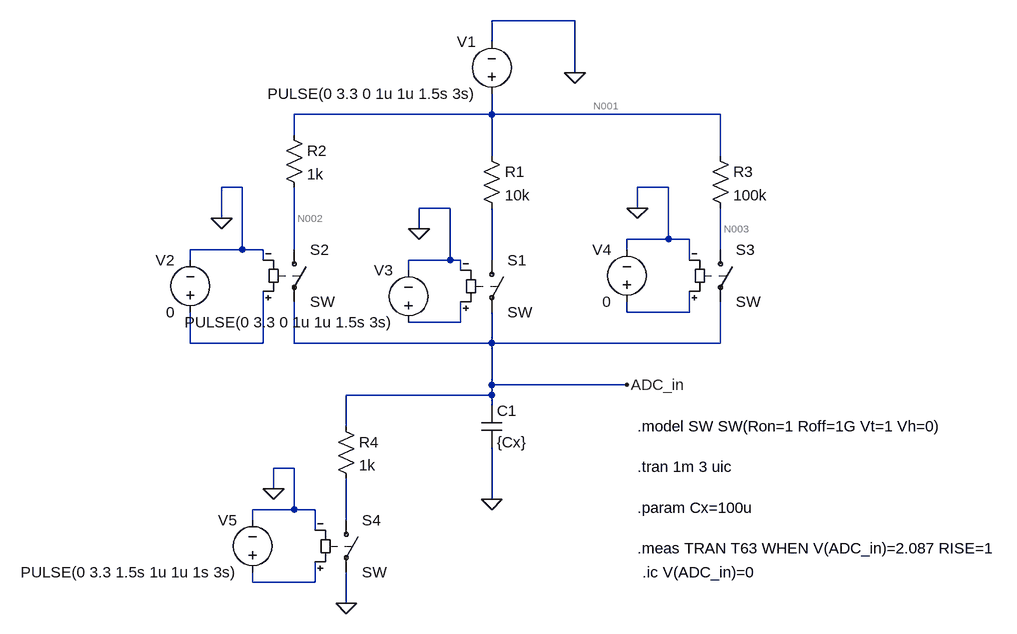
[diagram p0: schematic capacitor.asc]
capacitor.asc, the LTspice schematic file:
Version 4
SHEET 1 948 696
WIRE 272 -224 144 -224
WIRE 144 -192 144 -224
WIRE 272 -144 272 -224
WIRE 144 -80 144 -112
WIRE 144 -80 -160 -80
WIRE 496 -80 144 -80
WIRE -160 -48 -160 -80
WIRE 144 -16 144 -80
WIRE 496 -16 496 -80
WIRE -240 32 -272 32
WIRE 416 32 368 32
WIRE 80 64 32 64
WIRE 368 64 368 32
WIRE -272 80 -272 32
WIRE 32 96 32 64
WIRE 416 112 416 32
WIRE 416 112 352 112
WIRE 448 112 416 112
WIRE -240 128 -240 32
WIRE -240 128 -320 128
WIRE -208 128 -240 128
WIRE -160 128 -160 32
WIRE 352 128 352 112
WIRE 496 128 496 64
WIRE -320 144 -320 128
WIRE -208 144 -208 128
WIRE 80 144 80 64
WIRE 80 144 16 144
WIRE 96 144 80 144
WIRE 144 144 144 64
WIRE 448 144 448 112
WIRE 16 160 16 144
WIRE 96 160 96 144
WIRE 352 224 352 208
WIRE 448 224 448 192
WIRE 448 224 352 224
WIRE 96 240 96 208
WIRE 96 240 16 240
WIRE -320 272 -320 224
WIRE -208 272 -208 192
WIRE -208 272 -320 272
WIRE -160 272 -160 208
WIRE 144 272 144 224
WIRE 144 272 -160 272
WIRE 496 272 496 208
WIRE 496 272 144 272
WIRE 144 336 144 272
WIRE 352 336 144 336
WIRE 144 352 144 336
WIRE 144 352 -80 352
WIRE 144 368 144 352
WIRE -80 400 -80 352
WIRE -160 464 -192 464
WIRE -192 496 -192 464
WIRE 144 512 144 432
WIRE -160 528 -160 464
WIRE -160 528 -224 528
WIRE -128 528 -160 528
WIRE -224 544 -224 528
WIRE -80 544 -80 480
WIRE -128 560 -128 528
WIRE -224 640 -224 624
WIRE -128 640 -128 608
WIRE -128 640 -224 640
WIRE -80 672 -80 624
FLAG 144 512 0
FLAG 352 336 ADC_in
FLAG 272 -144 0
FLAG -272 80 0
FLAG 32 96 0
FLAG 368 64 0
FLAG -80 672 0
FLAG -192 496 0
SYMBOL cap 128 368 R0
SYMATTR InstName C1
SYMATTR Value {Cx}
SYMBOL sw 144 128 R0
SYMATTR InstName S1
SYMBOL sw -160 112 R0
SYMATTR InstName S2
SYMBOL sw 496 112 R0
SYMATTR InstName S3
SYMBOL res 128 -32 R0
SYMATTR InstName R1
SYMATTR Value 10k
SYMBOL res -176 -64 R0
SYMATTR InstName R2
SYMATTR Value 1k
SYMBOL res 480 -32 R0
SYMATTR InstName R3
SYMATTR Value 100k
SYMBOL voltage 144 -96 R180
WINDOW 0 24 96 Left 2
WINDOW 3 24 16 Left 2
WINDOW 123 0 0 Left 0
WINDOW 39 0 0 Left 0
SYMATTR InstName V1
SYMATTR Value PULSE(0 3.3 0 1u 1u 1.5s 3s)
SYMBOL voltage -320 240 R180
WINDOW 0 24 96 Left 2
WINDOW 3 24 16 Left 2
WINDOW 123 0 0 Left 0
WINDOW 39 0 0 Left 0
SYMATTR InstName V2
SYMATTR Value 0
SYMBOL voltage 16 256 R180
WINDOW 0 24 96 Left 2
WINDOW 3 24 16 Left 2
WINDOW 123 0 0 Left 0
WINDOW 39 0 0 Left 0
SYMATTR InstName V3
SYMATTR Value PULSE(0 3.3 0 1u 1u 1.5s 3s)
SYMBOL voltage 352 224 R180
WINDOW 0 24 96 Left 2
WINDOW 3 24 16 Left 2
WINDOW 123 0 0 Left 0
WINDOW 39 0 0 Left 0
SYMATTR InstName V4
SYMATTR Value 0
SYMBOL res -96 384 R0
SYMATTR InstName R4
SYMATTR Value 1k
SYMBOL sw -80 528 R0
SYMATTR InstName S4
SYMBOL voltage -224 640 R180
WINDOW 0 24 96 Left 2
WINDOW 3 24 16 Left 2
WINDOW 123 0 0 Left 0
WINDOW 39 0 0 Left 0
SYMATTR InstName V5
SYMATTR Value PULSE(0 3.3 1.5s 1u 1u 1s 3s)
TEXT 368 400 Left 2 !.model SW SW(Ron=1 Roff=1G Vt=1 Vh=0)\n \n.tran 1m 3 uic\n \n.param Cx=100u\n \n.meas TRAN T63 WHEN V(ADC_in)=2.087 RISE=1
TEXT 376 624 Left 2 !.ic V(ADC_in)=0

The netlist it stands for:
* capacitor.asc
C1 ADC_in 0 {Cx}
S1 N004 ADC_in N006 0 SW
S2 N002 ADC_in N007 0 SW
S3 N003 ADC_in N005 0 SW
R1 N001 N004 10k
R2 N001 N002 1k
R3 N001 N003 100k
V1 N001 0 PULSE(0 3.3 0 1u 1u 1.5s 3s)
V2 N007 0 0
V3 N006 0 PULSE(0 3.3 0 1u 1u 1.5s 3s)
V4 N005 0 0
R4 ADC_in N008 1k
S4 N008 0 N009 0 SW
V5 N009 0 PULSE(0 3.3 1.5s 1u 1u 1s 3s)
.model SW SW(Ron=1 Roff=1G Vt=1 Vh=0)
.tran 1m 3 uic
.param Cx=100u
.meas TRAN T63 WHEN V(ADC_in)=2.087 RISE=1
.ic V(ADC_in)=0
.backanno
.end

* Results of the author's LTspice run, read from the files saved beside the schematic
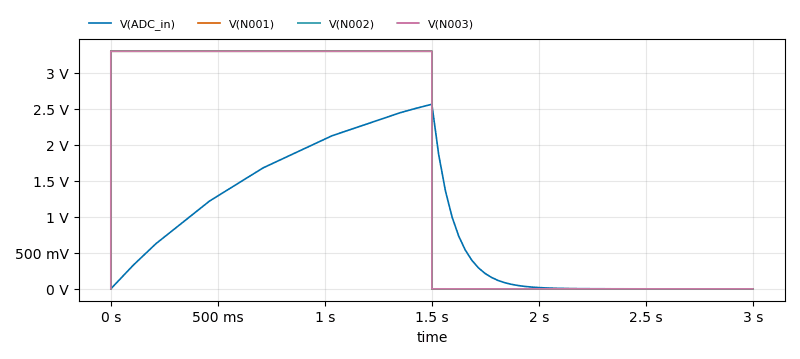
[diagram p1: Transient Analysis of capacitor.asc, plotted from the saved traces]
* Transient Analysis, 1 run:
*   V(ADC_in): min 0 V, max 2.564 V, average 877.4 mV, rms 1.282 V, last 117.5 µV
*   V(N001): min 0 V, max 3.3 V, average 1.65 V, rms 2.333 V, last 0 V
*   V(N002): min 0 V, max 3.3 V, average 1.65 V, rms 2.333 V, last 0 V
*   V(N003): min 0 V, max 3.3 V, average 1.65 V, rms 2.333 V, last 0 V
* From the log:
*   t63: v(adc_in)=2.087 AT 1.00137